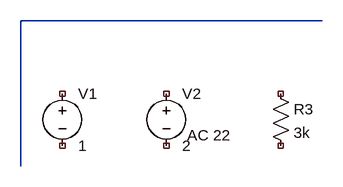
[diagram p0: schematic value2.asc]
value2.asc, the LTspice schematic file:
Version 4
SHEET 1 560 280
WIRE -32 -64 432 -64
WIRE -32 -64 -32 160
SYMBOL voltage 32 32 R0
SYMATTR InstName V1
SYMATTR Value 1
SYMATTR Value2 AC 11
SYMBOL voltage 192 32 R0
WINDOW 123 32 80 Left 2
WINDOW 39 0 0 Left 0
SYMATTR InstName V2
SYMATTR Value 2
SYMATTR Value2 AC 22
SYMBOL res 352 32 R0
SYMATTR InstName R3
SYMATTR Value 3k
SYMATTR Value2 tc=0.033

The netlist it stands for:
* value2.asc
V1 NC_01 NC_02 1 AC 11
V2 NC_03 NC_04 2 AC 22
R3 NC_05 NC_06 3k tc=0.033
.backanno
.end